# Altium project Interface_Board.PrjPcb (part 2 of 2)

## Sheet Stepper-Driver.SchDoc
size A4; DocumentNumber: 4; SheetNumber: 4
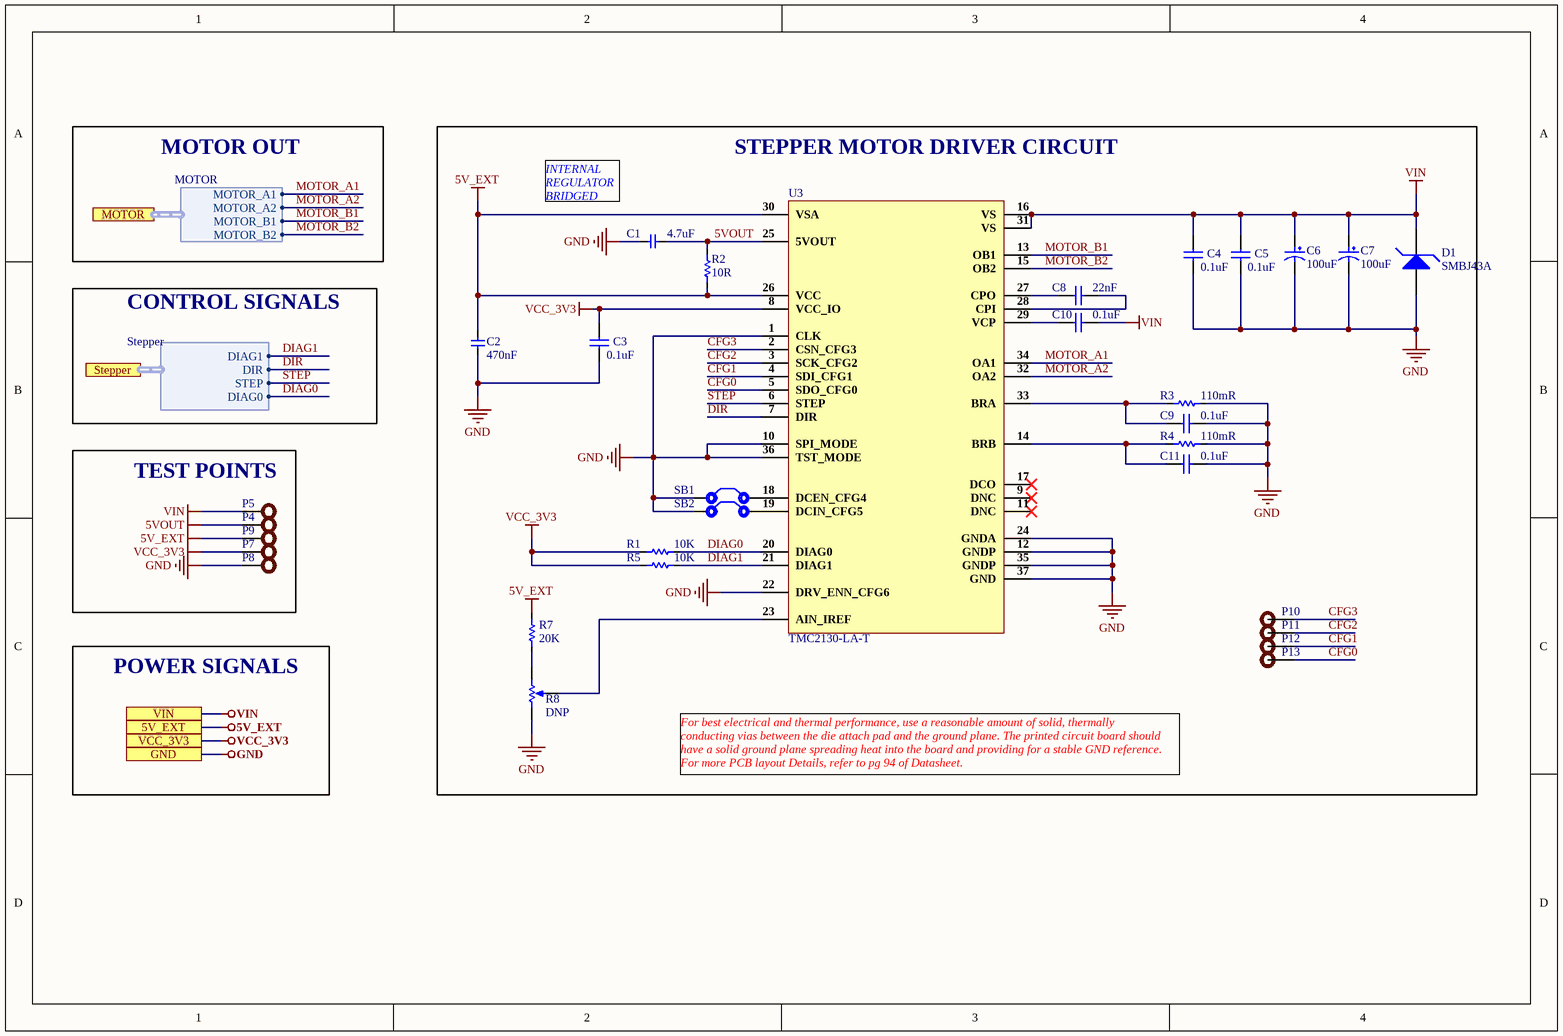
[diagram p3: Stepper-Driver.SchDoc]

### Parts
C1  4.7uF  [Cap-0402]
C2  470nF  [Cap-0402]
C3  0.1uF  [Cap-0402]
C4  0.1uF  [Cap0603]
C5  0.1uF  [Cap0603]
C6  100uF  [RVT1H101M0607]
C7  100uF  [RVT1H101M0607]
C8  22nF  [Cap0603]
C9  0.1uF  [Cap-0402]
C10  0.1uF  [Cap0603]
C11  0.1uF  [Cap-0402]
D1  SMBJ43A  [SMB_]
P4  Test Point  [TEST POINT]  (value not drawn)
P5  Test Point  [TEST POINT]  (value not drawn)
P7  Test Point  [TEST POINT]  (value not drawn)
P8  Test Point  [TEST POINT]  (value not drawn)
P9  Test Point  [TEST POINT]  (value not drawn)
P10  TEST POINT  [Test-point]  (value not drawn)
P11  TEST POINT  [Test-point]  (value not drawn)
P12  TEST POINT  [Test-point]  (value not drawn)
P13  TEST POINT  [Test-point]  (value not drawn)
R1  10K  [Res-0201]
R2  10R  [Res-0603]
R3  110mR  [Res_1210]
R4  110mR  [Res_1210]
R5  10K  [Res-0201]
R7  20K  [Res-0603]
R8  DNP  [VG039NCHXTB203]
SB1  Solder Bridge  [Solder Bridge]  (value not drawn)
SB2  Solder Bridge  [Solder Bridge]  (value not drawn)
U3  TMC2130-LA-T  [TMC2130-LA-T]

### Blocks framed on the sheet
STEPPER MOTOR DRIVER CIRCUIT: C1-C11 D1 P10-P13 R1-R5 R7 R8 SB1 SB2 U3
TEST POINTS: P4 P5 P7-P9

### Ports
5V_EXT, GND, MOTOR (harness MOTOR), Stepper (harness Stepper), VCC_3V3, VIN

### Harnesses
Stepper: DIAG1, DIR, STEP, DIAG0
MOTOR: MOTOR_A1, MOTOR_A2, MOTOR_B1, MOTOR_B2

### Nets
5V_EXT: C2.2 P9.1 R2.1 R7.2 U3.26(VCC) U3.30(VSA) ; port 5V_EXT
5VOUT: C1.2 P4.1 R2.2 U3.25(5VOUT)
GND: C1.1 C2.1 C3.1 C4.2 C5.2 C6.2 C7.2 C9.1 C11.1 D1.1(A) P8.1 R3.2 R4.2 R8.3 SB1.2 SB2.2 U3.1(CLK) U3.10(SPI_MODE) U3.12(GNDP) U3.22(DRV_ENN_CFG6) U3.24(GNDA) U3.35(GNDP) U3.36(TST_MODE) U3.37(GND) ; port GND
VCC_3V3: C3.2 P7.1 R1.1 R5.1 U3.8(VCC_IO) ; port VCC_3V3
VIN: C4.1 C5.1 C6.1 C7.1 C10.2 D1.2(K) P5.1 U3.16(VS) U3.31(VS) ; port VIN
CFG0: P13.1 U3.5(SDO_CFG0)
CFG1: P12.1 U3.4(SDI_CFG1)
CFG2: P11.1 U3.3(SCK_CFG2)
CFG3: P10.1 U3.2(CSN_CFG3)
DIAG0: R1.2 U3.20(DIAG0) ; port Stepper.DIAG0
DIAG1: R5.2 U3.21(DIAG1) ; port Stepper.DIAG1
DIR: U3.7(DIR) ; port Stepper.DIR
MOTOR_A1: U3.34(OA1) ; port MOTOR.MOTOR_A1
MOTOR_A2: U3.32(OA2) ; port MOTOR.MOTOR_A2
MOTOR_B1: U3.13(OB1) ; port MOTOR.MOTOR_B1
MOTOR_B2: U3.15(OB2) ; port MOTOR.MOTOR_B2
STEP: U3.6(STEP) ; port Stepper.STEP
NetC8_1: C8.1 U3.27(CPO)
NetC8_2: C8.2 U3.28(CPI)
NetC9_2: C9.2 R3.1 U3.33(BRA)
NetC10_1: C10.1 U3.29(VCP)
NetC11_2: C11.2 R4.1 U3.14(BRB)
NetR7_1: R7.1 R8.1
NetR8_2: R8.2 U3.23(AIN_IREF)
NetSB1_1: SB1.1 U3.18(DCEN_CFG4)
NetSB2_1: SB2.1 U3.19(DCIN_CFG5)

Not connected (* = marked no-connect by the designer): U3 9(DNC)* 11(DNC)* 17(DCO)*

### Notes on the sheet
- MOTOR OUT
- (near C1) INTERNAL
  REGULATOR
  BRIDGED
- CONTROL SIGNALS
- POWER SIGNALS
- For best electrical and thermal performance, use a reasonable amount of solid, thermally
  conducting vias between the die attach pad and the ground plane. The printed circuit board should
  have a solid ground plane spreading heat into the board and providing for a stable GND reference.
  For more PCB layout Details, refer to pg 94 of Datasheet.

### Library data of the parts
C1 = CC0402KRX5R6BB475: CAP CER 4.7UF 10V X5R 0402; Manufacturer: Yageo; Tolerance: 10%; Supplier 1: Farnell; Manufacturer Part Number: CC0402KRX5R6BB475; RoHS: Yes; Category: Ceramic Capacitors; Stock 1: 20000; Pricing 1: 10000=0.02310, 50000=0.02100 (GBP); Mount: Surface Mount; Case/Package: 0402; Case Code (Imperial): 0402; Case Code (Metric): 1005; Min Operating Temperature: -55°C; Max Operating Temperature: 85°C; Packaging: Cut Tape; Capacitance: 4.7uF; Voltage Rating: 10V; RoHS Compliant: Yes; ComponentLink1URL: http://www.yageo.com/documents/recent/UPY-GPHC_X5R_4V-to-50V_25.pdf?src-supplier=Digi-Key; ComponentLink1Description: http://www.yageo.com/documents/recent/UPY-GPHC_X5R_4V-to-50V_25.pdf?src-supplier=Digi-Key; Supplier Part Number 1: 3871698; LCSC Part Number: C326586
C2 = CC0402KRX5R7BB474: CAP CER 0.47UF 16V X5R 0402; Manufacturer: Yageo; Tolerance: 10%; Item Type: Capacitor; Supplier 1: Future Electronics; Manufacturer Part Number: CC0402KRX5R7BB474; RoHS: Yes; Category: Ceramic Capacitors; Stock 1: 10000; Pricing 1: 10000=0.01840, 20000=0.01800, 40000=0.01760, 50000=0.01750, 150000=0.01670 (USD); Mount: Surface Mount; Case/Package: 0402; Min Operating Temperature: -55°C; Max Operating Temperature: 85°C; Capacitance: 470nF; Packaging: Tape and Reel; Voltage Rating: 16V; Voltage Rating (DC): 16V; Length: 0.039inch; Width: 0.02inch; Thickness: 0.022inch; Lead Free: Lead Free; Halogen Free: Halogen Free; RoHS Compliant: Yes; ComponentLink1URL: http://www.yageo.com/documents/recent/UPY-GPHC_X5R_4V-to-50V_25.pdf?src-supplier=Digi-Key; ComponentLink1Description: http://www.yageo.com/documents/recent/UPY-GPHC_X5R_4V-to-50V_25.pdf?src-supplier=Digi-Key; ComponentLink2URL: http://www.yageo.com/exep/pages/download/literatures/ProductSelectionGuide%202014_Final_2.pdf?src-supplier=Digi-Key; ComponentLink2Description: http://www.yageo.com/exep/pages/download/literatures/ProductSelectionGuide%202014_Final_2.pdf?src-supplier=Digi-Key; Supplier Part Number 1: 1070400; LCSC Part Number: C527010
C3 C9 C11 = CC0402KRX7R8BB104: CAP CER 0.1UF 25V X7R 0402; Manufacturer: Yageo; Tolerance: 10%; Capacitance: 100nF; Dissipation Factor: 3.5%; Supplier 1: Digi-Key; Manufacturer Part Number: CC0402KRX7R8BB104; RoHS: Yes; Category: Ceramic Capacitors; Stock 1: 1841009; Pricing 1: 1=0.10000, 10=0.03100, 50=0.01700, 100=0.01390, 500=0.00990, 1000=0.00777, 2500=0.00707, 5000=0.00650 (USD); Mount: Surface Mount; Case/Package: 0402; Case Code (Imperial): 0402; Case Code (Metric): 1005; Min Operating Temperature: -55°C; Max Operating Temperature: 125°C; Dielectric: X7R; Voltage Rating: 25V; Voltage Rating (DC): 25V; Packaging: Tape and Reel; Termination: SMD/SMT; Resistor Type: Ceramic; Length: 1mm; Width: 0.02inch; Height: 0.5mm; Thickness: 0.022inch; Depth: 0.5mm; Radiation Hardening: No; Lead Free: Lead Free; Halogen Free: Halogen Free; ComponentLink1URL: https://datasheet.ciiva.com/11464/upy-gphc-x7r-6-3v-to-50v-8-11464889.pdf?src-supplier=Avnet; ComponentLink1Description: https://datasheet.ciiva.com/11464/upy-gphc-x7r-6-3v-to-50v-8-11464889.pdf?src-supplier=Avnet; ComponentLink2URL: https://datasheet.ciiva.com/13210/upy-gphc-x7r-6-3v-to-50v-8-12304-13210908.pdf?src-supplier=Mouser; ComponentLink2Description: https://datasheet.ciiva.com/13210/upy-gphc-x7r-6-3v-to-50v-8-12304-13210908.pdf?src-supplier=Mouser; ComponentLink3URL: https://datasheet.ciiva.com/17437/upy-gphc-x7r-6-3v-to-50v-8-17437357.pdf?src-supplier=Avnet+Europe; ComponentLink3Description: https://datasheet.ciiva.com/17437/upy-gphc-x7r-6-3v-to-50v-8-17437357.pdf?src-supplier=Avnet+Europe; Supplier Part Number 1: 311-2077-1-ND; LCSC Part Number: C105883
C4 C5 C10 = CC0603KRX7R0BB104: CAP CER 0.1UF 100V X7R 0603; Manufacturer: Yageo; Capacitance: 100nF; Tolerance: 10%; Supplier 1: Digi-Key; Manufacturer Part Number: CC0603KRX7R0BB104; RoHS: Yes; Category: Ceramic Capacitors; Stock 1: 60476; Pricing 1: 1=0.19000, 10=0.13500, 50=0.07680, 100=0.06370, 500=0.04466, 1000=0.03696 (USD); Mount: Surface Mount; Case/Package: 0603; Case Code (Metric): 1608; Case Code (Imperial): 0603; Weight: 7.1E-05oz; Min Operating Temperature: -55°C; Max Operating Temperature: 125°C; Package Quantity: 4000; Voltage Rating: 100V; Packaging: Tape and Reel; Dielectric: X7R; Termination: SMD/SMT; Resistor Type: Ceramic; Voltage Rating (DC): 100V; Series: CC; Length: 0.063inch; Width: 0.031inch; Thickness: 0.035inch; Depth: 0.8mm; Lead Free: Lead Free; RoHS Compliant: Yes; ComponentLink1URL: https://datasheet.ciiva.com/6277/mlccorderingcode-6277030.pdf?src-supplier=Digi-Key; ComponentLink1Description: https://datasheet.ciiva.com/6277/mlccorderingcode-6277030.pdf?src-supplier=Digi-Key; ComponentLink2URL: https://datasheet.ciiva.com/6277/mlccorderingcode-6277081.pdf?src-supplier=Digi-Key; ComponentLink2Description: https://datasheet.ciiva.com/6277/mlccorderingcode-6277081.pdf?src-supplier=Digi-Key; ComponentLink3URL: https://datasheet.ciiva.com/6277/mlccorderingcode-6277082.pdf?src-supplier=Digi-Key; ComponentLink3Description: https://datasheet.ciiva.com/6277/mlccorderingcode-6277082.pdf?src-supplier=Digi-Key; Supplier Part Number 1: 311-1523-1-ND
C6 C7 = RVT1H101M0607: 100uF 50V ±20% SMD,D6.3xL7.7mm Aluminum Electrolytic Capacitors - SMD ROHS; Manufacturer: ROQANG; Manufacturer Part Number: RVT1H101M0607; Package: SMD,D6.3xL7.7mm; LCSC Part Number: C3151829; Item Type: Capacitor; ComponentLink1Description: LCSC; ComponentLink1URL: https://www.lcsc.com/product-detail/Aluminum-Electrolytic-Capacitors-SMD_ROQANG-RVT1H101M0607_C3151829.html
C8 = CGA3E2X7R2A223K080AA: CAP CER 0.022UF 100V X7R 0603; Manufacturer: TDK; Tolerance: 10%; Supplier 1: Digi-Key; Manufacturer Part Number: CGA3E2X7R2A223K080AA; RoHS: Yes; Category: Ceramic Capacitors; Stock 1: 56079; Pricing 1: 1=0.11000, 10=0.07600, 50=0.04340, 100=0.03590, 500=0.02516, 1000=0.02083 (USD); Mount: Surface Mount; Case/Package: 0603; Case Code (Metric): 1608; Case Code (Imperial): 0603; Weight: 7.1E-05oz; Min Operating Temperature: -55°C; Max Operating Temperature: 125°C; Capacitance: 22nF; Voltage Rating: 100V; Packaging: Tape and Reel; Voltage Rating (DC): 100V; Dielectric: X7R; Termination: SMD/SMT; Series: CGA; Package Quantity: 1; Resistor Type: Ceramic; Length: 1.6mm; Width: 0.031inch; Height: 0.8mm; Thickness: 0.035inch; Depth: 0.8mm; Ratings: AEC-Q200; RoHS Compliant: Yes; REACH SVHC: No SVHC; ComponentLink1URL: https://datasheet.ciiva.com/22725/1735406-22725648.pdf?src-supplier=Element14; ComponentLink1Description: https://datasheet.ciiva.com/22725/1735406-22725648.pdf?src-supplier=Element14; ComponentLink2URL: https://datasheet.ciiva.com/24218/cga3e2x7r2a223k080aa-266292-24218959.pdf?src-supplier=Mouser; ComponentLink2Description: https://datasheet.ciiva.com/24218/cga3e2x7r2a223k080aa-266292-24218959.pdf?src-supplier=Mouser; ComponentLink3URL: https://datasheet.ciiva.com/7975/1807242-7975349.pdf?src-supplier=Element14; ComponentLink3Description: https://datasheet.ciiva.com/7975/1807242-7975349.pdf?src-supplier=Element14; Supplier Part Number 1: 445-5814-1-ND
D1 = SMBJ43A: 8.6A 69.4V 47.8V 43V Unidirectional SMB(DO-214AA) TVS ROHS; Manufacturer: RUILON; Item Type: Diode; Manufacturer Part Number: SMBJ43A; Package: SMB; ComponentLink1Description: LCSC; ComponentLink1URL: https://lcsc.com/product-detail/TVS_RUILON-Shenzhen-Ruilongyuan-Elec-SMBJ43A_C10222.html; LCSC Part: C10222
P4 P5 P7-P13 = TEST POINT: Test Point ON
R1 R5 = RC0201FR-0710KL: RES SMD 10K OHM 1% 1/20W 0201; Manufacturer: Yageo; Item Type: Resistor; Manufacturer Part Number: RC0201FR-0710KL; Package: 0201; ComponentLink7Description: LCSC; ComponentLink7URL: https://www.lcsc.com/product-detail/Chip-Resistor-Surface-Mount_YAGEO-RC0201FR-0710KL_C106225.html; LCSC Part Number: C106225
R2 = RC0603FR-0710RL: RES SMD 10 OHM 1% 1/10W 0603; Manufacturer: Yageo; Temperature Coefficient: 200ppm/°C; Power Rating: 100mW; Voltage Rating: 50V; Item type: Resistor; Supplier 1: Digi-Key; Manufacturer Part Number: RC0603FR-0710RL; Stock 1: 10836596; Pricing 1: 1=0.1, 10=0.046, 100=0.0187, 1000=0.0084, 2500=0.00729 (USD); Case/Package: 0603; Number of Pins: 2; Case Code (Imperial): 0603; Case Code (Metric): 1608; Contact Plating: Tin,Matte; Min Operating Temperature: -55°C; Max Operating Temperature: 155°C; Resistance: 10R; Tolerance: 1%; Composition: Thick Film; Packaging: Tape and Reel; Voltage Rating (DC): 50V; Termination: SMD/SMT; Military Standard: Not; Length: 1.6mm; Height: 0.45mm; Width: 0.8mm; Depth: 0.8mm; Radiation Hardening: No; Lead Free: Lead Free; REACH SVHC: No SVHC; ComponentLink1URL: http://www.farnell.com/datasheets/1868787.pdf?src-supplier=Element14; ComponentLink1Description: http://www.farnell.com/datasheets/1868787.pdf?src-supplier=Element14; ComponentLink2URL: http://www.yageo.com/documents/recent/PYu-RC0603_51_RoHS_L_4.pdf?src-supplier=Avnet; ComponentLink2Description: http://www.yageo.com/documents/recent/PYu-RC0603_51_RoHS_L_4.pdf?src-supplier=Avnet; ComponentLink3URL: http://documents.rs-components.com/techlib://itc_doclist_GB.htm?stockno=5048984&src-supplier=RSComponents; ComponentLink3Description: http://documents.rs-components.com/techlib://itc_doclist_GB.htm?stockno=5048984&src-supplier=RSComponents; ComponentLink4URL: http://www.yageo.com/documents/recent/PYu-RC0603_51_RoHS_L_4.pdf?src-supplier=Avnet+Europe; ComponentLink4Description: http://www.yageo.com/documents/recent/PYu-RC0603_51_RoHS_L_4.pdf?src-supplier=Avnet+Europe; Supplier Part Number 1: 311-10.0HRDKR-ND; LCSC Part Number: C109318
R3 R4 = FRL1210JR110TS: 500mW ±5% 110mΩ 1210 Chip Resistor - Surface Mount ROHS; Manufacturer: FOJAN; Manufacturer Part Number: FRL1210JR110TS; Package: 1210; LCSC Part Number: C3000678; Item Type: Resistor; ComponentLink1Description: LCSC; ComponentLink1URL: https://www.lcsc.com/product-detail/Chip-Resistor-Surface-Mount_FOJAN-FRL1210JR110TS_C3000678.html
R7 = RT0603BRD0720KL: RES SMD 20K OHM 0.1% 1/10W 0603; Manufacturer: Yageo; Power Rating: 100mW; Temperature Coefficient: 25ppm/°C; Resistance: 20kR; Voltage Rating: 75V; Voltage Rating (DC): 50V; Item Type: Resistor; Supplier 1: Arrow Electronics; Manufacturer Part Number: RT0603BRD0720KL; RoHS: Yes; Category: Chip SMD Resistors; Stock 1: 190000; Pricing 1: 5000=0.04300, 10000=0.03130, 25000=0.02970, 50000=0.02940, 125000=0.02040 (USD); Case/Package: 0603; Case Code (Imperial): 0603; Case Code (Metric): 1608; Weight: 7.1E-05oz; Contact Plating: Tin,Lead; Size Code: 0603; Min Operating Temperature: -55°C; Max Operating Temperature: 125°C; Tolerance: 0.1%; Packaging: Tape and Reel; Package Quantity: 5000; Resistor Type: Thin Film; Termination: SMD/SMT; Number of Terminations: 2; Max Power Dissipation: 100mW; Features: Moisture Resistant; Series: RT; Construction: Rectangular; Length: 1.6mm; Width: 0.8mm; Height: 0.022inch; Depth: 0.8mm; RoHS Compliant: Yes; Military Standard: Not; Lead Free: Lead Free; ComponentLink1URL: https://datasheet.ciiva.com/2585/pyu-rt-1-to-0-05-rohs-l-4-2585771.pdf?src-supplier=Digi-Key; ComponentLink1Description: https://datasheet.ciiva.com/2585/pyu-rt-1-to-0-05-rohs-l-4-2585771.pdf?src-supplier=Digi-Key; ComponentLink2URL: https://datasheet.ciiva.com/46634/pyu-rt-1-to-0-05-rohs-l-5-46634970.pdf?src-supplier=Digi-Key; ComponentLink2Description: https://datasheet.ciiva.com/46634/pyu-rt-1-to-0-05-rohs-l-5-46634970.pdf?src-supplier=Digi-Key; Supplier Part Number 1: RT0603BRD0720KL; LCSC Part Number: C723637
R8 = VG039NCHXTB203: ±25% 20kΩ SMD Variable Resistors/Potentiometers ROHS; Manufacturer: HDK(Hokuriku Elec Industry); Manufacturer Part Number: VG039NCHXTB203; Package: SMD; LCSC Part Number: C128550; Item Type: Potentiometer; ComponentLink1Description: LCSC; ComponentLink1URL: https://www.lcsc.com/product-detail/Variable-Resistors-Potentiometers_HDK-Hokuriku-Elec-Industry-VG039NCHXTB203_C128550.html
SB1 SB2 = Solder Bridge: Solder Bridge ON
U3 = TMC2130-LA-T: IC STEPPER MOTOR DVR SPI 36QFN; Manufacturer: Trinamic; Logic Function: AND GATE; Output Current: 1.4A; Supplier 1: Mouser; Manufacturer Part Number: TMC2130-LA-T; RoHS: Yes; Category: Motor Drivers; Stock 1: 19660; Pricing 1: 1=5.61000, 10=4.76000, 50=4.76000, 100=4.01000, 250=3.70000, 500=3.45000, 1000=2.90000, 2000=2.83000, 10000=2.83000 (USD); Mount: Surface Mount; Case/Package: QFN; Min Operating Temperature: -40°C; Max Operating Temperature: 125°C; Packaging: Tape and Reel; Interface: SPI; ComponentLink1URL: https://www.trinamic.com/fileadmin/assets/Products/ICs_Documents/TMC2130_datasheet.pdf?src-supplier=Digi-Key; ComponentLink1Description: https://www.trinamic.com/fileadmin/assets/Products/ICs_Documents/TMC2130_datasheet.pdf?src-supplier=Digi-Key; Supplier Part Number 1: 700-TMC2130-LA-T

## Nets that join several sheets
5V_EXT: Power-Section (8 pins), Stepper-Driver (6 pins)
GND: Power-Section (25 pins), Connector_Section (19 pins), Stepper-Driver (24 pins)
VCC_3V3: Power-Section (C23.2 C24.2 U1.3), Connector_Section (J1.1 J1.3), Stepper-Driver (5 pins)
VIN: Power-Section (C13.2 C14.2 R6.2 U2.2), Connector_Section (D5.1), Stepper-Driver (9 pins)
VOUT_12V: Power-Section (9 pins), Connector_Section (D3.2 P2.1)
DIAG0: Connector_Section (J1.20), Stepper-Driver (R1.2 U3.20)
DIAG1: Connector_Section (J1.17), Stepper-Driver (R5.2 U3.21)
DIR: Connector_Section (J1.21), Stepper-Driver (U3.7)
MOTOR_A1: Connector_Section (P1.1), Stepper-Driver (U3.34)
MOTOR_A2: Connector_Section (P1.2), Stepper-Driver (U3.32)
MOTOR_B1: Connector_Section (P1.3), Stepper-Driver (U3.13)
MOTOR_B2: Connector_Section (P1.4), Stepper-Driver (U3.15)
STEP: Connector_Section (J1.19), Stepper-Driver (U3.6)